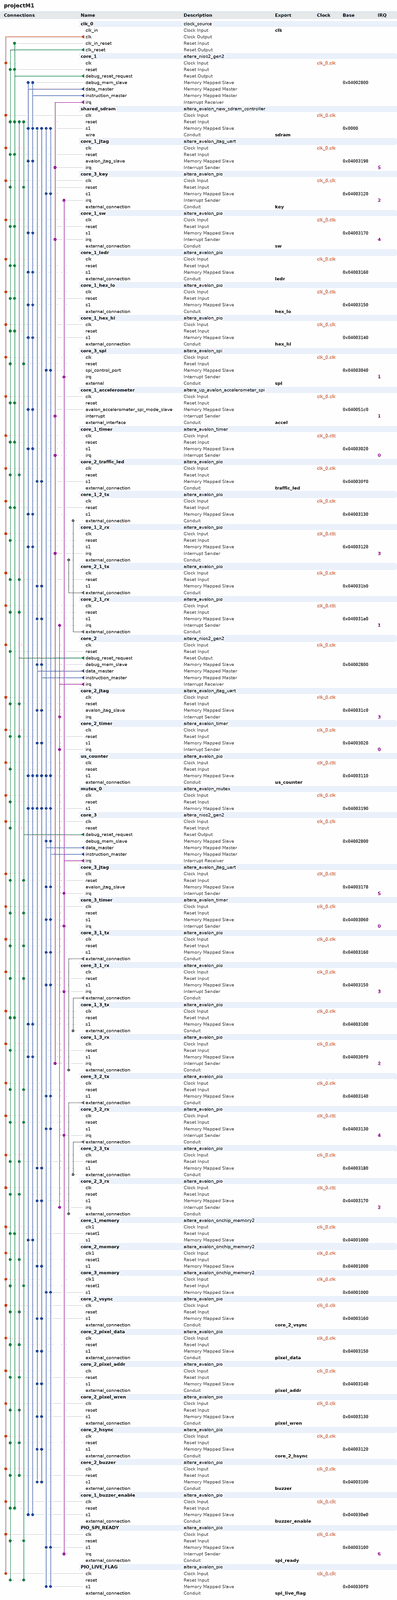
[diagram p0: system contents, whole]
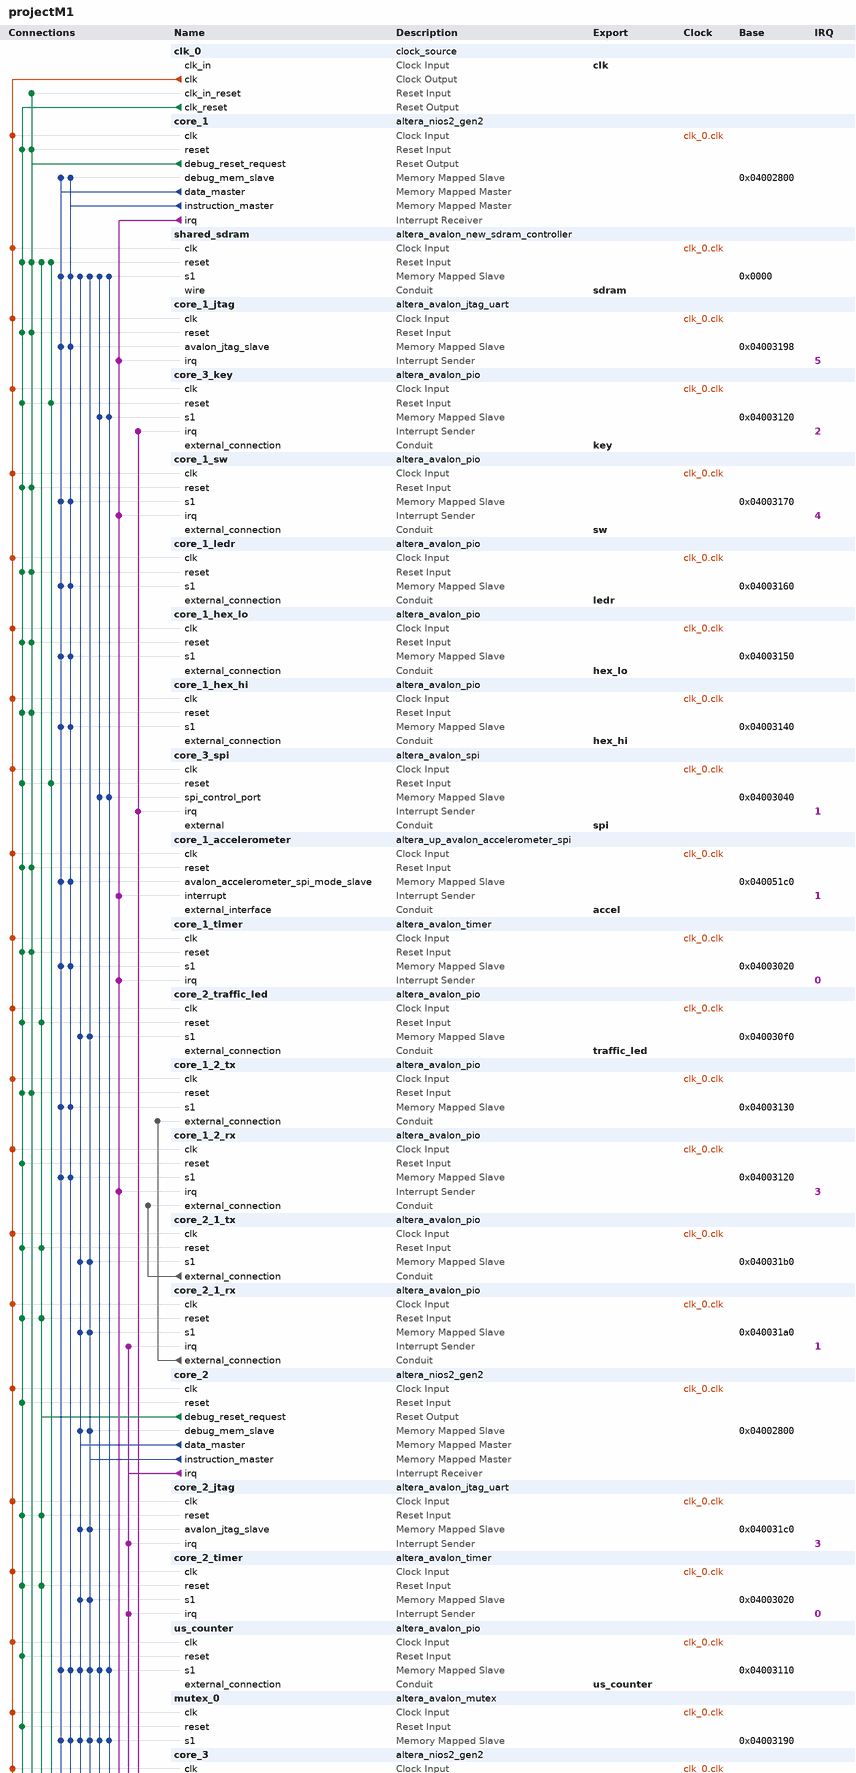
[diagram p1: system contents, upper part]
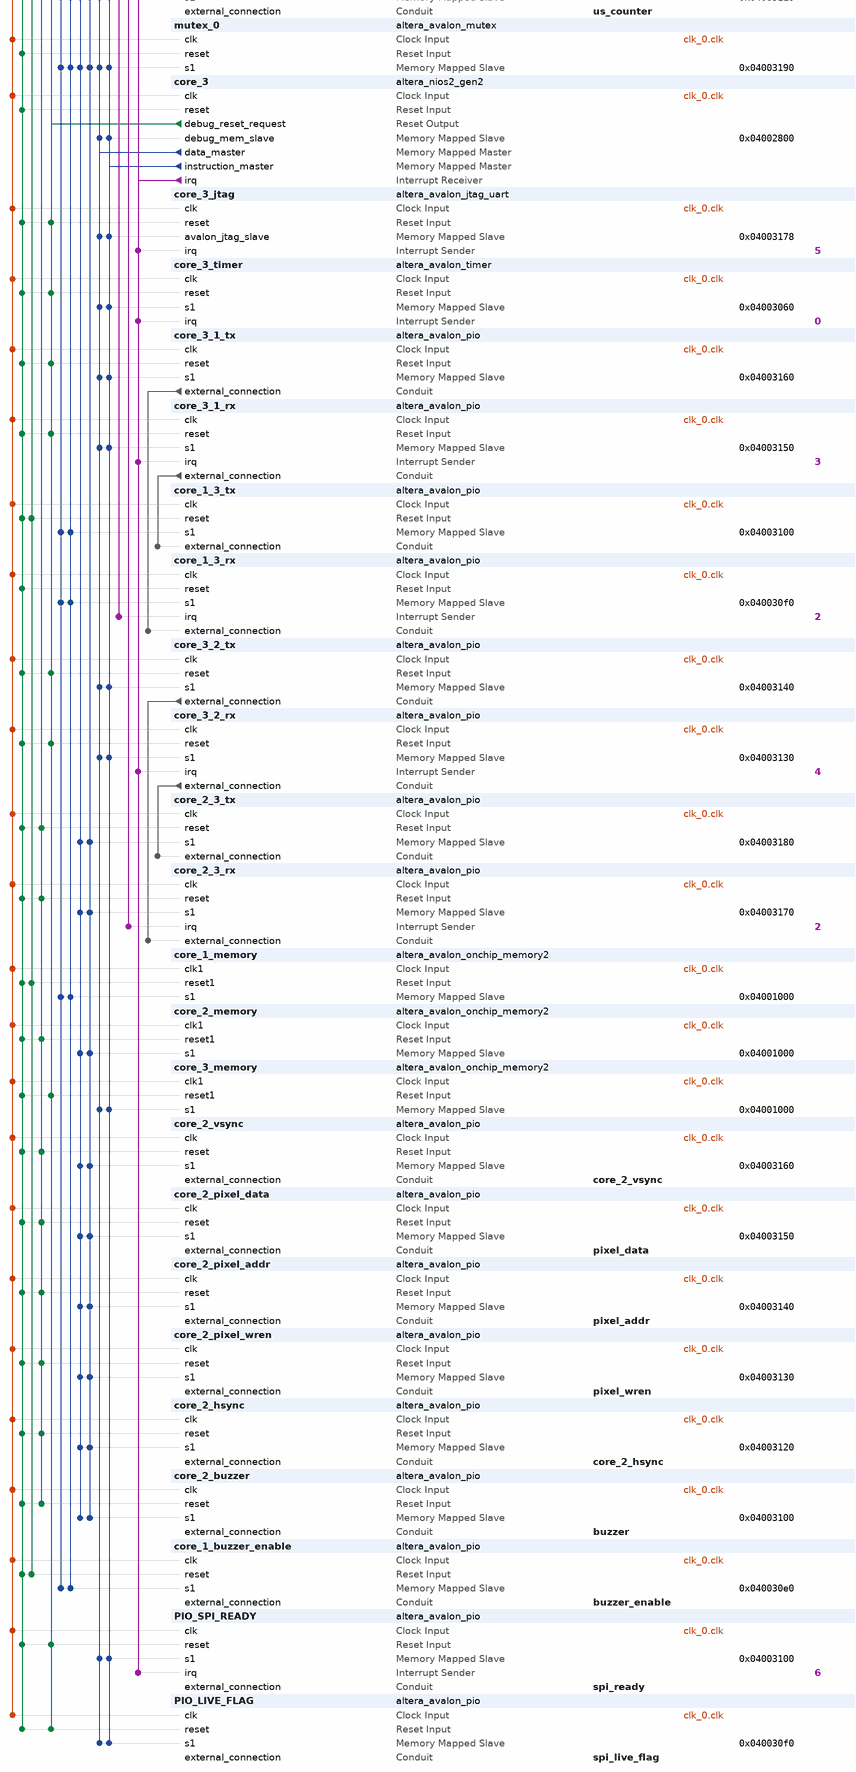
[diagram p2: system contents, lower part]
# Platform Designer (Qsys) system projectM1, MAX 10 10M50DAF484C7G
# Parameters at their usual value, and those the tool derives, are not listed.
package require -exact qsys 18.1
create_system projectM1
set_project_property DEVICE_FAMILY {MAX 10}
set_project_property DEVICE 10M50DAF484C7G

add_instance clk_0 clock_source 18.1
set_instance_parameter_value clk_0 clockFrequency 50000000

add_instance core_1 altera_nios2_gen2 18.1
set_instance_parameter_value core_1 dcache_size 2048
set_instance_parameter_value core_1 exceptionSlave core_1_memory.s1
set_instance_parameter_value core_1 icache_size 4096
set_instance_parameter_value core_1 impl Tiny
set_instance_parameter_value core_1 resetSlave core_1_memory.s1

add_instance shared_sdram altera_avalon_new_sdram_controller 18.1
set_instance_parameter_value shared_sdram TAC 5.5
set_instance_parameter_value shared_sdram TRCD 20.0
set_instance_parameter_value shared_sdram TRP 20.0
set_instance_parameter_value shared_sdram casLatency 3
set_instance_parameter_value shared_sdram columnWidth 10
set_instance_parameter_value shared_sdram dataWidth 16
set_instance_parameter_value shared_sdram generateSimulationModel false
set_instance_parameter_value shared_sdram model single_Micron_MT48LC4M32B2_7_chip
set_instance_parameter_value shared_sdram numberOfBanks 4
set_instance_parameter_value shared_sdram numberOfChipSelects 1
set_instance_parameter_value shared_sdram powerUpDelay 100.0
set_instance_parameter_value shared_sdram refreshPeriod 15.625
set_instance_parameter_value shared_sdram rowWidth 13

add_instance core_1_jtag altera_avalon_jtag_uart 18.1
set_instance_parameter_value core_1_jtag simInteractiveOptions NO_INTERACTIVE_WINDOWS

add_instance core_3_key altera_avalon_pio 18.1
set_instance_parameter_value core_3_key captureEdge true
set_instance_parameter_value core_3_key direction Input
set_instance_parameter_value core_3_key generateIRQ true
set_instance_parameter_value core_3_key irqType EDGE
set_instance_parameter_value core_3_key width 2

add_instance core_1_sw altera_avalon_pio 18.1
set_instance_parameter_value core_1_sw captureEdge true
set_instance_parameter_value core_1_sw direction Input
set_instance_parameter_value core_1_sw generateIRQ true
set_instance_parameter_value core_1_sw irqType EDGE
set_instance_parameter_value core_1_sw width 10

add_instance core_1_ledr altera_avalon_pio 18.1
set_instance_parameter_value core_1_ledr direction Output
set_instance_parameter_value core_1_ledr width 10

add_instance core_1_hex_lo altera_avalon_pio 18.1
set_instance_parameter_value core_1_hex_lo direction Output
set_instance_parameter_value core_1_hex_lo width 24

add_instance core_1_hex_hi altera_avalon_pio 18.1
set_instance_parameter_value core_1_hex_hi direction Output
set_instance_parameter_value core_1_hex_hi width 24

add_instance core_3_spi altera_avalon_spi 18.1
set_instance_parameter_value core_3_spi clockPolarity 0
set_instance_parameter_value core_3_spi dataWidth 8
set_instance_parameter_value core_3_spi masterSPI true
set_instance_parameter_value core_3_spi numberOfSlaves 1
set_instance_parameter_value core_3_spi targetClockRate 5000000

add_instance core_1_accelerometer altera_up_avalon_accelerometer_spi 18.0

add_instance core_1_timer altera_avalon_timer 18.1
set_instance_parameter_value core_1_timer period 1
set_instance_parameter_value core_1_timer periodUnits MSEC

add_instance core_2_traffic_led altera_avalon_pio 18.1
set_instance_parameter_value core_2_traffic_led direction Output
set_instance_parameter_value core_2_traffic_led width 3

add_instance core_1_2_tx altera_avalon_pio 18.1
set_instance_parameter_value core_1_2_tx direction Output
set_instance_parameter_value core_1_2_tx width 8

add_instance core_1_2_rx altera_avalon_pio 18.1
set_instance_parameter_value core_1_2_rx captureEdge true
set_instance_parameter_value core_1_2_rx direction Input
set_instance_parameter_value core_1_2_rx generateIRQ true
set_instance_parameter_value core_1_2_rx irqType EDGE
set_instance_parameter_value core_1_2_rx width 4

add_instance core_2_1_tx altera_avalon_pio 18.1
set_instance_parameter_value core_2_1_tx direction Output
set_instance_parameter_value core_2_1_tx width 4

add_instance core_2_1_rx altera_avalon_pio 18.1
set_instance_parameter_value core_2_1_rx captureEdge true
set_instance_parameter_value core_2_1_rx direction Input
set_instance_parameter_value core_2_1_rx generateIRQ true
set_instance_parameter_value core_2_1_rx irqType EDGE
set_instance_parameter_value core_2_1_rx width 8

add_instance core_2 altera_nios2_gen2 18.1
set_instance_parameter_value core_2 cpuID 1
set_instance_parameter_value core_2 dcache_size 2048
set_instance_parameter_value core_2 exceptionSlave core_2_memory.s1
set_instance_parameter_value core_2 icache_size 4096
set_instance_parameter_value core_2 impl Fast
set_instance_parameter_value core_2 resetSlave core_2_memory.s1

add_instance core_2_jtag altera_avalon_jtag_uart 18.1
set_instance_parameter_value core_2_jtag simInteractiveOptions NO_INTERACTIVE_WINDOWS

add_instance core_2_timer altera_avalon_timer 18.1
set_instance_parameter_value core_2_timer period 1
set_instance_parameter_value core_2_timer periodUnits MSEC

add_instance us_counter altera_avalon_pio 18.1
set_instance_parameter_value us_counter direction Input
set_instance_parameter_value us_counter width 32

add_instance mutex_0 altera_avalon_mutex 18.1

add_instance core_3 altera_nios2_gen2 18.1
set_instance_parameter_value core_3 cpuID 2
set_instance_parameter_value core_3 dcache_size 2048
set_instance_parameter_value core_3 exceptionSlave core_3_memory.s1
set_instance_parameter_value core_3 icache_size 4096
set_instance_parameter_value core_3 impl Fast
set_instance_parameter_value core_3 resetSlave core_3_memory.s1

add_instance core_3_jtag altera_avalon_jtag_uart 18.1
set_instance_parameter_value core_3_jtag simInteractiveOptions NO_INTERACTIVE_WINDOWS

add_instance core_3_timer altera_avalon_timer 18.1
set_instance_parameter_value core_3_timer period 1
set_instance_parameter_value core_3_timer periodUnits MSEC

add_instance core_3_1_tx altera_avalon_pio 18.1
set_instance_parameter_value core_3_1_tx direction Output
set_instance_parameter_value core_3_1_tx width 4

add_instance core_3_1_rx altera_avalon_pio 18.1
set_instance_parameter_value core_3_1_rx captureEdge true
set_instance_parameter_value core_3_1_rx direction Input
set_instance_parameter_value core_3_1_rx generateIRQ true
set_instance_parameter_value core_3_1_rx irqType EDGE
set_instance_parameter_value core_3_1_rx width 4

add_instance core_1_3_tx altera_avalon_pio 18.1
set_instance_parameter_value core_1_3_tx direction Output
set_instance_parameter_value core_1_3_tx width 4

add_instance core_1_3_rx altera_avalon_pio 18.1
set_instance_parameter_value core_1_3_rx captureEdge true
set_instance_parameter_value core_1_3_rx direction Input
set_instance_parameter_value core_1_3_rx generateIRQ true
set_instance_parameter_value core_1_3_rx irqType EDGE
set_instance_parameter_value core_1_3_rx width 4

add_instance core_3_2_tx altera_avalon_pio 18.1
set_instance_parameter_value core_3_2_tx direction Output
set_instance_parameter_value core_3_2_tx width 4

add_instance core_3_2_rx altera_avalon_pio 18.1
set_instance_parameter_value core_3_2_rx captureEdge true
set_instance_parameter_value core_3_2_rx direction Input
set_instance_parameter_value core_3_2_rx generateIRQ true
set_instance_parameter_value core_3_2_rx irqType EDGE
set_instance_parameter_value core_3_2_rx width 4

add_instance core_2_3_tx altera_avalon_pio 18.1
set_instance_parameter_value core_2_3_tx direction Output
set_instance_parameter_value core_2_3_tx width 4

add_instance core_2_3_rx altera_avalon_pio 18.1
set_instance_parameter_value core_2_3_rx captureEdge true
set_instance_parameter_value core_2_3_rx direction Input
set_instance_parameter_value core_2_3_rx generateIRQ true
set_instance_parameter_value core_2_3_rx irqType EDGE
set_instance_parameter_value core_2_3_rx width 4

add_instance core_1_memory altera_avalon_onchip_memory2 18.1
set_instance_parameter_value core_1_memory dataWidth 32
set_instance_parameter_value core_1_memory dualPort false
set_instance_parameter_value core_1_memory initMemContent true
set_instance_parameter_value core_1_memory initializationFileName onchip_mem.hex
set_instance_parameter_value core_1_memory memorySize 4096

add_instance core_2_memory altera_avalon_onchip_memory2 18.1
set_instance_parameter_value core_2_memory dataWidth 32
set_instance_parameter_value core_2_memory dualPort false
set_instance_parameter_value core_2_memory initMemContent true
set_instance_parameter_value core_2_memory initializationFileName onchip_mem.hex
set_instance_parameter_value core_2_memory memorySize 4096

add_instance core_3_memory altera_avalon_onchip_memory2 18.1
set_instance_parameter_value core_3_memory dataWidth 32
set_instance_parameter_value core_3_memory dualPort false
set_instance_parameter_value core_3_memory initMemContent true
set_instance_parameter_value core_3_memory initializationFileName onchip_mem.hex
set_instance_parameter_value core_3_memory memorySize 4096

add_instance core_2_vsync altera_avalon_pio 18.1
set_instance_parameter_value core_2_vsync direction Input
set_instance_parameter_value core_2_vsync width 1

add_instance core_2_pixel_data altera_avalon_pio 18.1
set_instance_parameter_value core_2_pixel_data direction Output
set_instance_parameter_value core_2_pixel_data width 12

add_instance core_2_pixel_addr altera_avalon_pio 18.1
set_instance_parameter_value core_2_pixel_addr direction Output
set_instance_parameter_value core_2_pixel_addr width 17

add_instance core_2_pixel_wren altera_avalon_pio 18.1
set_instance_parameter_value core_2_pixel_wren direction Output
set_instance_parameter_value core_2_pixel_wren width 1

add_instance core_2_hsync altera_avalon_pio 18.1
set_instance_parameter_value core_2_hsync direction Input
set_instance_parameter_value core_2_hsync width 1

add_instance core_2_buzzer altera_avalon_pio 18.1
set_instance_parameter_value core_2_buzzer direction Output
set_instance_parameter_value core_2_buzzer width 5

add_instance core_1_buzzer_enable altera_avalon_pio 18.1
set_instance_parameter_value core_1_buzzer_enable direction Output
set_instance_parameter_value core_1_buzzer_enable width 1

add_instance PIO_SPI_READY altera_avalon_pio 18.1
set_instance_parameter_value PIO_SPI_READY captureEdge true
set_instance_parameter_value PIO_SPI_READY direction Input
set_instance_parameter_value PIO_SPI_READY generateIRQ true
set_instance_parameter_value PIO_SPI_READY irqType EDGE
set_instance_parameter_value PIO_SPI_READY width 1

add_instance PIO_LIVE_FLAG altera_avalon_pio 18.1
set_instance_parameter_value PIO_LIVE_FLAG direction Output
set_instance_parameter_value PIO_LIVE_FLAG width 1

# connections
add_connection clk_0.clk core_1.clk clock
add_connection clk_0.clk core_1_2_rx.clk clock
add_connection clk_0.clk core_1_2_tx.clk clock
add_connection clk_0.clk core_1_3_rx.clk clock
add_connection clk_0.clk core_1_3_tx.clk clock
add_connection clk_0.clk core_1_accelerometer.clk clock
add_connection clk_0.clk core_1_buzzer_enable.clk clock
add_connection clk_0.clk core_1_hex_hi.clk clock
add_connection clk_0.clk core_1_hex_lo.clk clock
add_connection clk_0.clk core_1_jtag.clk clock
add_connection clk_0.clk core_1_ledr.clk clock
add_connection clk_0.clk core_1_memory.clk1 clock
add_connection clk_0.clk core_1_sw.clk clock
add_connection clk_0.clk core_1_timer.clk clock
add_connection clk_0.clk core_2.clk clock
add_connection clk_0.clk core_2_1_rx.clk clock
add_connection clk_0.clk core_2_1_tx.clk clock
add_connection clk_0.clk core_2_3_rx.clk clock
add_connection clk_0.clk core_2_3_tx.clk clock
add_connection clk_0.clk core_2_buzzer.clk clock
add_connection clk_0.clk core_2_hsync.clk clock
add_connection clk_0.clk core_2_jtag.clk clock
add_connection clk_0.clk core_2_memory.clk1 clock
add_connection clk_0.clk core_2_pixel_addr.clk clock
add_connection clk_0.clk core_2_pixel_data.clk clock
add_connection clk_0.clk core_2_pixel_wren.clk clock
add_connection clk_0.clk core_2_timer.clk clock
add_connection clk_0.clk core_2_traffic_led.clk clock
add_connection clk_0.clk core_2_vsync.clk clock
add_connection clk_0.clk core_3.clk clock
add_connection clk_0.clk core_3_1_rx.clk clock
add_connection clk_0.clk core_3_1_tx.clk clock
add_connection clk_0.clk core_3_2_rx.clk clock
add_connection clk_0.clk core_3_2_tx.clk clock
add_connection clk_0.clk core_3_jtag.clk clock
add_connection clk_0.clk core_3_key.clk clock
add_connection clk_0.clk core_3_memory.clk1 clock
add_connection clk_0.clk core_3_spi.clk clock
add_connection clk_0.clk core_3_timer.clk clock
add_connection clk_0.clk mutex_0.clk clock
add_connection clk_0.clk PIO_LIVE_FLAG.clk clock
add_connection clk_0.clk PIO_SPI_READY.clk clock
add_connection clk_0.clk shared_sdram.clk clock
add_connection clk_0.clk us_counter.clk clock
add_connection clk_0.clk_reset core_1.reset reset
add_connection clk_0.clk_reset core_1_2_rx.reset reset
add_connection clk_0.clk_reset core_1_2_tx.reset reset
add_connection clk_0.clk_reset core_1_3_rx.reset reset
add_connection clk_0.clk_reset core_1_3_tx.reset reset
add_connection clk_0.clk_reset core_1_accelerometer.reset reset
add_connection clk_0.clk_reset core_1_buzzer_enable.reset reset
add_connection clk_0.clk_reset core_1_hex_hi.reset reset
add_connection clk_0.clk_reset core_1_hex_lo.reset reset
add_connection clk_0.clk_reset core_1_jtag.reset reset
add_connection clk_0.clk_reset core_1_ledr.reset reset
add_connection clk_0.clk_reset core_1_memory.reset1 reset
add_connection clk_0.clk_reset core_1_sw.reset reset
add_connection clk_0.clk_reset core_1_timer.reset reset
add_connection clk_0.clk_reset core_2.reset reset
add_connection clk_0.clk_reset core_2_1_rx.reset reset
add_connection clk_0.clk_reset core_2_1_tx.reset reset
add_connection clk_0.clk_reset core_2_3_rx.reset reset
add_connection clk_0.clk_reset core_2_3_tx.reset reset
add_connection clk_0.clk_reset core_2_buzzer.reset reset
add_connection clk_0.clk_reset core_2_hsync.reset reset
add_connection clk_0.clk_reset core_2_jtag.reset reset
add_connection clk_0.clk_reset core_2_memory.reset1 reset
add_connection clk_0.clk_reset core_2_pixel_addr.reset reset
add_connection clk_0.clk_reset core_2_pixel_data.reset reset
add_connection clk_0.clk_reset core_2_pixel_wren.reset reset
add_connection clk_0.clk_reset core_2_timer.reset reset
add_connection clk_0.clk_reset core_2_traffic_led.reset reset
add_connection clk_0.clk_reset core_2_vsync.reset reset
add_connection clk_0.clk_reset core_3.reset reset
add_connection clk_0.clk_reset core_3_1_rx.reset reset
add_connection clk_0.clk_reset core_3_1_tx.reset reset
add_connection clk_0.clk_reset core_3_2_rx.reset reset
add_connection clk_0.clk_reset core_3_2_tx.reset reset
add_connection clk_0.clk_reset core_3_jtag.reset reset
add_connection clk_0.clk_reset core_3_key.reset reset
add_connection clk_0.clk_reset core_3_memory.reset1 reset
add_connection clk_0.clk_reset core_3_spi.reset reset
add_connection clk_0.clk_reset core_3_timer.reset reset
add_connection clk_0.clk_reset mutex_0.reset reset
add_connection clk_0.clk_reset PIO_LIVE_FLAG.reset reset
add_connection clk_0.clk_reset PIO_SPI_READY.reset reset
add_connection clk_0.clk_reset shared_sdram.reset reset
add_connection clk_0.clk_reset us_counter.reset reset
add_connection core_1.debug_reset_request clk_0.clk_in_reset reset
add_connection core_1.debug_reset_request core_1.reset reset
add_connection core_1.debug_reset_request core_1_2_tx.reset reset
add_connection core_1.debug_reset_request core_1_3_tx.reset reset
add_connection core_1.debug_reset_request core_1_accelerometer.reset reset
add_connection core_1.debug_reset_request core_1_buzzer_enable.reset reset
add_connection core_1.debug_reset_request core_1_hex_hi.reset reset
add_connection core_1.debug_reset_request core_1_hex_lo.reset reset
add_connection core_1.debug_reset_request core_1_jtag.reset reset
add_connection core_1.debug_reset_request core_1_ledr.reset reset
add_connection core_1.debug_reset_request core_1_memory.reset1 reset
add_connection core_1.debug_reset_request core_1_sw.reset reset
add_connection core_1.debug_reset_request core_1_timer.reset reset
add_connection core_1.debug_reset_request shared_sdram.reset reset
add_connection core_2.debug_reset_request core_2_1_rx.reset reset
add_connection core_2.debug_reset_request core_2_1_tx.reset reset
add_connection core_2.debug_reset_request core_2_3_rx.reset reset
add_connection core_2.debug_reset_request core_2_3_tx.reset reset
add_connection core_2.debug_reset_request core_2_buzzer.reset reset
add_connection core_2.debug_reset_request core_2_hsync.reset reset
add_connection core_2.debug_reset_request core_2_jtag.reset reset
add_connection core_2.debug_reset_request core_2_memory.reset1 reset
add_connection core_2.debug_reset_request core_2_pixel_addr.reset reset
add_connection core_2.debug_reset_request core_2_pixel_data.reset reset
add_connection core_2.debug_reset_request core_2_pixel_wren.reset reset
add_connection core_2.debug_reset_request core_2_timer.reset reset
add_connection core_2.debug_reset_request core_2_traffic_led.reset reset
add_connection core_2.debug_reset_request core_2_vsync.reset reset
add_connection core_2.debug_reset_request shared_sdram.reset reset
add_connection core_3.debug_reset_request core_3_1_rx.reset reset
add_connection core_3.debug_reset_request core_3_1_tx.reset reset
add_connection core_3.debug_reset_request core_3_2_rx.reset reset
add_connection core_3.debug_reset_request core_3_2_tx.reset reset
add_connection core_3.debug_reset_request core_3_jtag.reset reset
add_connection core_3.debug_reset_request core_3_key.reset reset
add_connection core_3.debug_reset_request core_3_memory.reset1 reset
add_connection core_3.debug_reset_request core_3_spi.reset reset
add_connection core_3.debug_reset_request core_3_timer.reset reset
add_connection core_3.debug_reset_request PIO_LIVE_FLAG.reset reset
add_connection core_3.debug_reset_request PIO_SPI_READY.reset reset
add_connection core_3.debug_reset_request shared_sdram.reset reset
add_connection core_1.data_master core_1.debug_mem_slave avalon
set_connection_parameter_value core_1.data_master/core_1.debug_mem_slave baseAddress 0x04002800
add_connection core_1.data_master core_1_2_rx.s1 avalon
set_connection_parameter_value core_1.data_master/core_1_2_rx.s1 baseAddress 0x04003120
add_connection core_1.data_master core_1_2_tx.s1 avalon
set_connection_parameter_value core_1.data_master/core_1_2_tx.s1 baseAddress 0x04003130
add_connection core_1.data_master core_1_3_rx.s1 avalon
set_connection_parameter_value core_1.data_master/core_1_3_rx.s1 baseAddress 0x040030f0
add_connection core_1.data_master core_1_3_tx.s1 avalon
set_connection_parameter_value core_1.data_master/core_1_3_tx.s1 baseAddress 0x04003100
add_connection core_1.data_master core_1_accelerometer.avalon_accelerometer_spi_mode_slave avalon
set_connection_parameter_value core_1.data_master/core_1_accelerometer.avalon_accelerometer_spi_mode_slave baseAddress 0x040051c0
add_connection core_1.data_master core_1_buzzer_enable.s1 avalon
set_connection_parameter_value core_1.data_master/core_1_buzzer_enable.s1 baseAddress 0x040030e0
add_connection core_1.data_master core_1_hex_hi.s1 avalon
set_connection_parameter_value core_1.data_master/core_1_hex_hi.s1 baseAddress 0x04003140
add_connection core_1.data_master core_1_hex_lo.s1 avalon
set_connection_parameter_value core_1.data_master/core_1_hex_lo.s1 baseAddress 0x04003150
add_connection core_1.data_master core_1_jtag.avalon_jtag_slave avalon
set_connection_parameter_value core_1.data_master/core_1_jtag.avalon_jtag_slave baseAddress 0x04003198
add_connection core_1.data_master core_1_ledr.s1 avalon
set_connection_parameter_value core_1.data_master/core_1_ledr.s1 baseAddress 0x04003160
add_connection core_1.data_master core_1_memory.s1 avalon
set_connection_parameter_value core_1.data_master/core_1_memory.s1 baseAddress 0x04001000
add_connection core_1.data_master core_1_sw.s1 avalon
set_connection_parameter_value core_1.data_master/core_1_sw.s1 baseAddress 0x04003170
add_connection core_1.data_master core_1_timer.s1 avalon
set_connection_parameter_value core_1.data_master/core_1_timer.s1 baseAddress 0x04003020
add_connection core_1.data_master mutex_0.s1 avalon
set_connection_parameter_value core_1.data_master/mutex_0.s1 baseAddress 0x04003190
add_connection core_1.data_master shared_sdram.s1 avalon
set_connection_parameter_value core_1.data_master/shared_sdram.s1 baseAddress 0x0000
add_connection core_1.data_master us_counter.s1 avalon
set_connection_parameter_value core_1.data_master/us_counter.s1 baseAddress 0x04003110
add_connection core_1.instruction_master core_1.debug_mem_slave avalon
set_connection_parameter_value core_1.instruction_master/core_1.debug_mem_slave baseAddress 0x04002800
add_connection core_1.instruction_master core_1_2_rx.s1 avalon
set_connection_parameter_value core_1.instruction_master/core_1_2_rx.s1 baseAddress 0x04003120
add_connection core_1.instruction_master core_1_2_tx.s1 avalon
set_connection_parameter_value core_1.instruction_master/core_1_2_tx.s1 baseAddress 0x04003130
add_connection core_1.instruction_master core_1_3_rx.s1 avalon
set_connection_parameter_value core_1.instruction_master/core_1_3_rx.s1 baseAddress 0x040030f0
add_connection core_1.instruction_master core_1_3_tx.s1 avalon
set_connection_parameter_value core_1.instruction_master/core_1_3_tx.s1 baseAddress 0x04003100
add_connection core_1.instruction_master core_1_accelerometer.avalon_accelerometer_spi_mode_slave avalon
set_connection_parameter_value core_1.instruction_master/core_1_accelerometer.avalon_accelerometer_spi_mode_slave baseAddress 0x040051c0
add_connection core_1.instruction_master core_1_buzzer_enable.s1 avalon
set_connection_parameter_value core_1.instruction_master/core_1_buzzer_enable.s1 baseAddress 0x040030e0
add_connection core_1.instruction_master core_1_hex_hi.s1 avalon
set_connection_parameter_value core_1.instruction_master/core_1_hex_hi.s1 baseAddress 0x04003140
add_connection core_1.instruction_master core_1_hex_lo.s1 avalon
set_connection_parameter_value core_1.instruction_master/core_1_hex_lo.s1 baseAddress 0x04003150
add_connection core_1.instruction_master core_1_jtag.avalon_jtag_slave avalon
set_connection_parameter_value core_1.instruction_master/core_1_jtag.avalon_jtag_slave baseAddress 0x04003198
add_connection core_1.instruction_master core_1_ledr.s1 avalon
set_connection_parameter_value core_1.instruction_master/core_1_ledr.s1 baseAddress 0x04003160
add_connection core_1.instruction_master core_1_memory.s1 avalon
set_connection_parameter_value core_1.instruction_master/core_1_memory.s1 baseAddress 0x04001000
add_connection core_1.instruction_master core_1_sw.s1 avalon
set_connection_parameter_value core_1.instruction_master/core_1_sw.s1 baseAddress 0x04003170
add_connection core_1.instruction_master core_1_timer.s1 avalon
set_connection_parameter_value core_1.instruction_master/core_1_timer.s1 baseAddress 0x04003020
add_connection core_1.instruction_master mutex_0.s1 avalon
set_connection_parameter_value core_1.instruction_master/mutex_0.s1 baseAddress 0x04003190
add_connection core_1.instruction_master shared_sdram.s1 avalon
set_connection_parameter_value core_1.instruction_master/shared_sdram.s1 baseAddress 0x0000
add_connection core_1.instruction_master us_counter.s1 avalon
set_connection_parameter_value core_1.instruction_master/us_counter.s1 baseAddress 0x04003110
add_connection core_2.data_master core_2.debug_mem_slave avalon
set_connection_parameter_value core_2.data_master/core_2.debug_mem_slave baseAddress 0x04002800
add_connection core_2.data_master core_2_1_rx.s1 avalon
set_connection_parameter_value core_2.data_master/core_2_1_rx.s1 baseAddress 0x040031a0
add_connection core_2.data_master core_2_1_tx.s1 avalon
set_connection_parameter_value core_2.data_master/core_2_1_tx.s1 baseAddress 0x040031b0
add_connection core_2.data_master core_2_3_rx.s1 avalon
set_connection_parameter_value core_2.data_master/core_2_3_rx.s1 baseAddress 0x04003170
add_connection core_2.data_master core_2_3_tx.s1 avalon
set_connection_parameter_value core_2.data_master/core_2_3_tx.s1 baseAddress 0x04003180
add_connection core_2.data_master core_2_buzzer.s1 avalon
set_connection_parameter_value core_2.data_master/core_2_buzzer.s1 baseAddress 0x04003100
add_connection core_2.data_master core_2_hsync.s1 avalon
set_connection_parameter_value core_2.data_master/core_2_hsync.s1 baseAddress 0x04003120
add_connection core_2.data_master core_2_jtag.avalon_jtag_slave avalon
set_connection_parameter_value core_2.data_master/core_2_jtag.avalon_jtag_slave baseAddress 0x040031c0
add_connection core_2.data_master core_2_memory.s1 avalon
set_connection_parameter_value core_2.data_master/core_2_memory.s1 baseAddress 0x04001000
add_connection core_2.data_master core_2_pixel_addr.s1 avalon
set_connection_parameter_value core_2.data_master/core_2_pixel_addr.s1 baseAddress 0x04003140
add_connection core_2.data_master core_2_pixel_data.s1 avalon
set_connection_parameter_value core_2.data_master/core_2_pixel_data.s1 baseAddress 0x04003150
add_connection core_2.data_master core_2_pixel_wren.s1 avalon
set_connection_parameter_value core_2.data_master/core_2_pixel_wren.s1 baseAddress 0x04003130
add_connection core_2.data_master core_2_timer.s1 avalon
set_connection_parameter_value core_2.data_master/core_2_timer.s1 baseAddress 0x04003020
add_connection core_2.data_master core_2_traffic_led.s1 avalon
set_connection_parameter_value core_2.data_master/core_2_traffic_led.s1 baseAddress 0x040030f0
add_connection core_2.data_master core_2_vsync.s1 avalon
set_connection_parameter_value core_2.data_master/core_2_vsync.s1 baseAddress 0x04003160
add_connection core_2.data_master mutex_0.s1 avalon
set_connection_parameter_value core_2.data_master/mutex_0.s1 baseAddress 0x04003190
add_connection core_2.data_master shared_sdram.s1 avalon
set_connection_parameter_value core_2.data_master/shared_sdram.s1 baseAddress 0x0000
add_connection core_2.data_master us_counter.s1 avalon
set_connection_parameter_value core_2.data_master/us_counter.s1 baseAddress 0x04003110
add_connection core_2.instruction_master core_2.debug_mem_slave avalon
set_connection_parameter_value core_2.instruction_master/core_2.debug_mem_slave baseAddress 0x04002800
add_connection core_2.instruction_master core_2_1_rx.s1 avalon
set_connection_parameter_value core_2.instruction_master/core_2_1_rx.s1 baseAddress 0x040031a0
add_connection core_2.instruction_master core_2_1_tx.s1 avalon
set_connection_parameter_value core_2.instruction_master/core_2_1_tx.s1 baseAddress 0x040031b0
add_connection core_2.instruction_master core_2_3_rx.s1 avalon
set_connection_parameter_value core_2.instruction_master/core_2_3_rx.s1 baseAddress 0x04003170
add_connection core_2.instruction_master core_2_3_tx.s1 avalon
set_connection_parameter_value core_2.instruction_master/core_2_3_tx.s1 baseAddress 0x04003180
add_connection core_2.instruction_master core_2_buzzer.s1 avalon
set_connection_parameter_value core_2.instruction_master/core_2_buzzer.s1 baseAddress 0x04003100
add_connection core_2.instruction_master core_2_hsync.s1 avalon
set_connection_parameter_value core_2.instruction_master/core_2_hsync.s1 baseAddress 0x04003120
add_connection core_2.instruction_master core_2_jtag.avalon_jtag_slave avalon
set_connection_parameter_value core_2.instruction_master/core_2_jtag.avalon_jtag_slave baseAddress 0x040031c0
add_connection core_2.instruction_master core_2_memory.s1 avalon
set_connection_parameter_value core_2.instruction_master/core_2_memory.s1 baseAddress 0x04001000
add_connection core_2.instruction_master core_2_pixel_addr.s1 avalon
set_connection_parameter_value core_2.instruction_master/core_2_pixel_addr.s1 baseAddress 0x04003140
add_connection core_2.instruction_master core_2_pixel_data.s1 avalon
set_connection_parameter_value core_2.instruction_master/core_2_pixel_data.s1 baseAddress 0x04003150
add_connection core_2.instruction_master core_2_pixel_wren.s1 avalon
set_connection_parameter_value core_2.instruction_master/core_2_pixel_wren.s1 baseAddress 0x04003130
add_connection core_2.instruction_master core_2_timer.s1 avalon
set_connection_parameter_value core_2.instruction_master/core_2_timer.s1 baseAddress 0x04003020
add_connection core_2.instruction_master core_2_traffic_led.s1 avalon
set_connection_parameter_value core_2.instruction_master/core_2_traffic_led.s1 baseAddress 0x040030f0
add_connection core_2.instruction_master core_2_vsync.s1 avalon
set_connection_parameter_value core_2.instruction_master/core_2_vsync.s1 baseAddress 0x04003160
add_connection core_2.instruction_master mutex_0.s1 avalon
set_connection_parameter_value core_2.instruction_master/mutex_0.s1 baseAddress 0x04003190
add_connection core_2.instruction_master shared_sdram.s1 avalon
set_connection_parameter_value core_2.instruction_master/shared_sdram.s1 baseAddress 0x0000
add_connection core_2.instruction_master us_counter.s1 avalon
set_connection_parameter_value core_2.instruction_master/us_counter.s1 baseAddress 0x04003110
add_connection core_3.data_master core_3.debug_mem_slave avalon
set_connection_parameter_value core_3.data_master/core_3.debug_mem_slave baseAddress 0x04002800
add_connection core_3.data_master core_3_1_rx.s1 avalon
set_connection_parameter_value core_3.data_master/core_3_1_rx.s1 baseAddress 0x04003150
add_connection core_3.data_master core_3_1_tx.s1 avalon
set_connection_parameter_value core_3.data_master/core_3_1_tx.s1 baseAddress 0x04003160
add_connection core_3.data_master core_3_2_rx.s1 avalon
set_connection_parameter_value core_3.data_master/core_3_2_rx.s1 baseAddress 0x04003130
add_connection core_3.data_master core_3_2_tx.s1 avalon
set_connection_parameter_value core_3.data_master/core_3_2_tx.s1 baseAddress 0x04003140
add_connection core_3.data_master core_3_jtag.avalon_jtag_slave avalon
set_connection_parameter_value core_3.data_master/core_3_jtag.avalon_jtag_slave baseAddress 0x04003178
add_connection core_3.data_master core_3_key.s1 avalon
set_connection_parameter_value core_3.data_master/core_3_key.s1 baseAddress 0x04003120
add_connection core_3.data_master core_3_memory.s1 avalon
set_connection_parameter_value core_3.data_master/core_3_memory.s1 baseAddress 0x04001000
add_connection core_3.data_master core_3_spi.spi_control_port avalon
set_connection_parameter_value core_3.data_master/core_3_spi.spi_control_port baseAddress 0x04003040
add_connection core_3.data_master core_3_timer.s1 avalon
set_connection_parameter_value core_3.data_master/core_3_timer.s1 baseAddress 0x04003060
add_connection core_3.data_master mutex_0.s1 avalon
set_connection_parameter_value core_3.data_master/mutex_0.s1 baseAddress 0x04003190
add_connection core_3.data_master PIO_LIVE_FLAG.s1 avalon
set_connection_parameter_value core_3.data_master/PIO_LIVE_FLAG.s1 baseAddress 0x040030f0
add_connection core_3.data_master PIO_SPI_READY.s1 avalon
set_connection_parameter_value core_3.data_master/PIO_SPI_READY.s1 baseAddress 0x04003100
add_connection core_3.data_master shared_sdram.s1 avalon
set_connection_parameter_value core_3.data_master/shared_sdram.s1 baseAddress 0x0000
add_connection core_3.data_master us_counter.s1 avalon
set_connection_parameter_value core_3.data_master/us_counter.s1 baseAddress 0x04003110
add_connection core_3.instruction_master core_3.debug_mem_slave avalon
set_connection_parameter_value core_3.instruction_master/core_3.debug_mem_slave baseAddress 0x04002800
add_connection core_3.instruction_master core_3_1_rx.s1 avalon
set_connection_parameter_value core_3.instruction_master/core_3_1_rx.s1 baseAddress 0x04003150
add_connection core_3.instruction_master core_3_1_tx.s1 avalon
set_connection_parameter_value core_3.instruction_master/core_3_1_tx.s1 baseAddress 0x04003160
add_connection core_3.instruction_master core_3_2_rx.s1 avalon
set_connection_parameter_value core_3.instruction_master/core_3_2_rx.s1 baseAddress 0x04003130
add_connection core_3.instruction_master core_3_2_tx.s1 avalon
set_connection_parameter_value core_3.instruction_master/core_3_2_tx.s1 baseAddress 0x04003140
add_connection core_3.instruction_master core_3_jtag.avalon_jtag_slave avalon
set_connection_parameter_value core_3.instruction_master/core_3_jtag.avalon_jtag_slave baseAddress 0x04003178
add_connection core_3.instruction_master core_3_key.s1 avalon
set_connection_parameter_value core_3.instruction_master/core_3_key.s1 baseAddress 0x04003120
add_connection core_3.instruction_master core_3_memory.s1 avalon
set_connection_parameter_value core_3.instruction_master/core_3_memory.s1 baseAddress 0x04001000
add_connection core_3.instruction_master core_3_spi.spi_control_port avalon
set_connection_parameter_value core_3.instruction_master/core_3_spi.spi_control_port baseAddress 0x04003040
add_connection core_3.instruction_master core_3_timer.s1 avalon
set_connection_parameter_value core_3.instruction_master/core_3_timer.s1 baseAddress 0x04003060
add_connection core_3.instruction_master mutex_0.s1 avalon
set_connection_parameter_value core_3.instruction_master/mutex_0.s1 baseAddress 0x04003190
add_connection core_3.instruction_master PIO_LIVE_FLAG.s1 avalon
set_connection_parameter_value core_3.instruction_master/PIO_LIVE_FLAG.s1 baseAddress 0x040030f0
add_connection core_3.instruction_master PIO_SPI_READY.s1 avalon
set_connection_parameter_value core_3.instruction_master/PIO_SPI_READY.s1 baseAddress 0x04003100
add_connection core_3.instruction_master shared_sdram.s1 avalon
set_connection_parameter_value core_3.instruction_master/shared_sdram.s1 baseAddress 0x0000
add_connection core_3.instruction_master us_counter.s1 avalon
set_connection_parameter_value core_3.instruction_master/us_counter.s1 baseAddress 0x04003110
add_connection core_2_1_rx.external_connection core_1_2_tx.external_connection conduit
add_connection core_2_1_tx.external_connection core_1_2_rx.external_connection conduit
add_connection core_3_1_rx.external_connection core_1_3_tx.external_connection conduit
add_connection core_3_1_tx.external_connection core_1_3_rx.external_connection conduit
add_connection core_3_2_rx.external_connection core_2_3_tx.external_connection conduit
add_connection core_3_2_tx.external_connection core_2_3_rx.external_connection conduit
add_connection core_1.irq core_1_2_rx.irq interrupt
set_connection_parameter_value core_1.irq/core_1_2_rx.irq irqNumber 3
add_connection core_1.irq core_1_3_rx.irq interrupt
set_connection_parameter_value core_1.irq/core_1_3_rx.irq irqNumber 2
add_connection core_1.irq core_1_accelerometer.interrupt interrupt
set_connection_parameter_value core_1.irq/core_1_accelerometer.interrupt irqNumber 1
add_connection core_1.irq core_1_jtag.irq interrupt
set_connection_parameter_value core_1.irq/core_1_jtag.irq irqNumber 5
add_connection core_1.irq core_1_sw.irq interrupt
set_connection_parameter_value core_1.irq/core_1_sw.irq irqNumber 4
add_connection core_1.irq core_1_timer.irq interrupt
set_connection_parameter_value core_1.irq/core_1_timer.irq irqNumber 0
add_connection core_2.irq core_2_1_rx.irq interrupt
set_connection_parameter_value core_2.irq/core_2_1_rx.irq irqNumber 1
add_connection core_2.irq core_2_3_rx.irq interrupt
set_connection_parameter_value core_2.irq/core_2_3_rx.irq irqNumber 2
add_connection core_2.irq core_2_jtag.irq interrupt
set_connection_parameter_value core_2.irq/core_2_jtag.irq irqNumber 3
add_connection core_2.irq core_2_timer.irq interrupt
set_connection_parameter_value core_2.irq/core_2_timer.irq irqNumber 0
add_connection core_3.irq core_3_1_rx.irq interrupt
set_connection_parameter_value core_3.irq/core_3_1_rx.irq irqNumber 3
add_connection core_3.irq core_3_2_rx.irq interrupt
set_connection_parameter_value core_3.irq/core_3_2_rx.irq irqNumber 4
add_connection core_3.irq core_3_jtag.irq interrupt
set_connection_parameter_value core_3.irq/core_3_jtag.irq irqNumber 5
add_connection core_3.irq core_3_key.irq interrupt
set_connection_parameter_value core_3.irq/core_3_key.irq irqNumber 2
add_connection core_3.irq core_3_spi.irq interrupt
set_connection_parameter_value core_3.irq/core_3_spi.irq irqNumber 1
add_connection core_3.irq core_3_timer.irq interrupt
set_connection_parameter_value core_3.irq/core_3_timer.irq irqNumber 0
add_connection core_3.irq PIO_SPI_READY.irq interrupt
set_connection_parameter_value core_3.irq/PIO_SPI_READY.irq irqNumber 6

# exported interfaces
add_interface accel conduit end
set_interface_property accel EXPORT_OF core_1_accelerometer.external_interface
add_interface buzzer conduit end
set_interface_property buzzer EXPORT_OF core_2_buzzer.external_connection
add_interface buzzer_enable conduit end
set_interface_property buzzer_enable EXPORT_OF core_1_buzzer_enable.external_connection
add_interface clk clock sink
set_interface_property clk EXPORT_OF clk_0.clk_in
add_interface core_2_hsync conduit end
set_interface_property core_2_hsync EXPORT_OF core_2_hsync.external_connection
add_interface core_2_vsync conduit end
set_interface_property core_2_vsync EXPORT_OF core_2_vsync.external_connection
add_interface hex_hi conduit end
set_interface_property hex_hi EXPORT_OF core_1_hex_hi.external_connection
add_interface hex_lo conduit end
set_interface_property hex_lo EXPORT_OF core_1_hex_lo.external_connection
add_interface key conduit end
set_interface_property key EXPORT_OF core_3_key.external_connection
add_interface ledr conduit end
set_interface_property ledr EXPORT_OF core_1_ledr.external_connection
add_interface pixel_addr conduit end
set_interface_property pixel_addr EXPORT_OF core_2_pixel_addr.external_connection
add_interface pixel_data conduit end
set_interface_property pixel_data EXPORT_OF core_2_pixel_data.external_connection
add_interface pixel_wren conduit end
set_interface_property pixel_wren EXPORT_OF core_2_pixel_wren.external_connection
add_interface sdram conduit end
set_interface_property sdram EXPORT_OF shared_sdram.wire
add_interface spi conduit end
set_interface_property spi EXPORT_OF core_3_spi.external
add_interface spi_live_flag conduit end
set_interface_property spi_live_flag EXPORT_OF PIO_LIVE_FLAG.external_connection
add_interface spi_ready conduit end
set_interface_property spi_ready EXPORT_OF PIO_SPI_READY.external_connection
add_interface sw conduit end
set_interface_property sw EXPORT_OF core_1_sw.external_connection
add_interface traffic_led conduit end
set_interface_property traffic_led EXPORT_OF core_2_traffic_led.external_connection
add_interface us_counter conduit end
set_interface_property us_counter EXPORT_OF us_counter.external_connection

set_interconnect_requirement {$system} qsys_mm.clockCrossingAdapter HANDSHAKE
set_interconnect_requirement {$system} qsys_mm.enableEccProtection FALSE
set_interconnect_requirement {$system} qsys_mm.insertDefaultSlave FALSE
set_interconnect_requirement {$system} qsys_mm.maxAdditionalLatency 1

save_system projectM1.qsys
